# Altium schematic sheet POWER.SchDoc
size A2; SheetNumber: 3; SheetTotal: 3
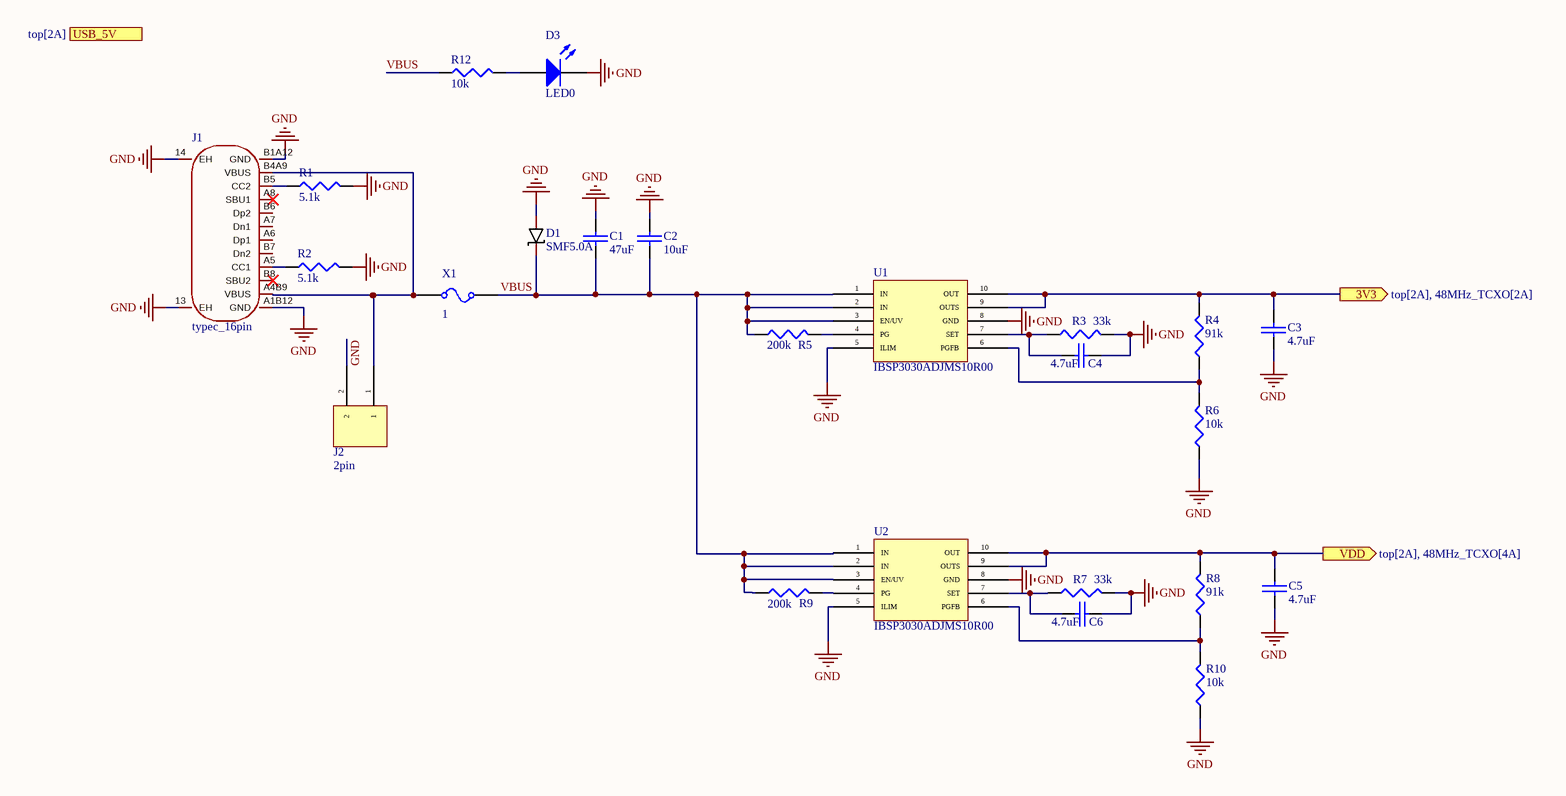
[diagram p0: POWER.SchDoc]

## Parts
C1  47uF  [0402_Z]
C2  10uF  [0603_Z]
C3  4.7uF  [0603_Z]
C4  4.7uF  [0603_Z]
C5  4.7uF  [0603_Z]
C6  4.7uF  [0603_Z]
D1  SMF5.0A  [SMF5.0A]
D3  LED0  [0603_Z]
J1  typec_16pin  [TYPEC_16PIN]
J2  2pin  [H2-2mm]
R1  5.1k  [0402_Z]
R2  5.1k  [0402_Z]
R3  33k  [0402_Z]
R4  91k  [0402_Z]
R5  200k  [0402_Z]
R6  10k  [0402_Z]
R7  33k  [0402_Z]
R8  91k  [0402_Z]
R9  200k  [0402_Z]
R10  10k  [0402_Z]
R12  10k  [0402_Z]
U1  IBSP3030ADJMS10R00  [IBSP3030ADJMS10R00]
U2  IBSP3030ADJMS10R00  [IBSP3030ADJMS10R00]
X1  CURRENT: 1  [F1206]  (hidden comment: Fuse)

## Ports
3V3 (out, see top[2A], 48MHz_TCXO[2A]), USB_5V (in, see top[2A]), VDD (out, see top[2A], 48MHz_TCXO[4A])

## Nets
GND: C1.1 C2.1 C3.2 C4.1 C5.2 C6.1 D1.2 D3.2(K) J1.13(EH) J1.14(EH) J1.A1B12(GND) J1.B1A12(GND) J2.2 R1.2 R2.2 R3.2 R6.1 R7.2 R10.1 U1.5(ILIM) U1.8(GND) U2.5(ILIM) U2.8(GND)
3V3: C3.1 R4.2 U1.9(OUTS) U1.10(OUT) ; port 3V3
VBUS: C1.2 C2.2 D1.1 R5.1 R9.1 R12.1 U1.1(IN) U1.2(IN) U1.3(EN/UV) U2.1(IN) U2.2(IN) U2.3(EN/UV) X1.1
VDD: C5.1 R8.2 U2.9(OUTS) U2.10(OUT) ; port VDD
NetC4_2: C4.2 R3.1 U1.7(SET)
NetC6_2: C6.2 R7.1 U2.7(SET)
NetD3_1: D3.1(A) R12.2
NetJ1_A4B9: J1.A4B9(VBUS) J1.B4A9(VBUS) J2.1 X1.2
NetJ1_A5: J1.A5(CC1) R2.1
NetJ1_B5: J1.B5(CC2) R1.1
NetR4_1: R4.1 R6.2 U1.6(PGFB)
NetR5_2: R5.2 U1.4(PG)
NetR8_1: R8.1 R10.2 U2.6(PGFB)
NetR9_2: R9.2 U2.4(PG)

Not connected (* = marked no-connect by the designer): J1 A6(Dp1) A7(Dn1) A8(SBU1)* B6(Dp2) B7(Dn2) B8(SBU2)*

## Library data of the parts
C1 = CAP: 0805; Value: 20pF  NP0
C2 = CAP: 0603; Value: 20pF  NP0
C3-C6 = CAP: 0402; Value: 20pF  NP0
D3 = LED0: Typical INFRARED GaAs LED; Published: 8-Jun-2000; LatestRevisionDate: 08-Jul-2005; LatestRevisionNote: Mech Layer 1 removed.; PackageReference: LED-0; Publisher: Altium Limited; PackageDescription: LED; 2 Leads
R1-R10 R12 = Res3: Resistor; Published: 8-Jun-2000; LatestRevisionDate: 04-Mar-2005; LatestRevisionNote: PCB Footprint replaced.; PackageReference: J1-0603; Publisher: Altium Limited
  R1 R2: Value: 5.1k
  R3 R7: Value: 33k
  R4 R8: Value: 91k
  R5 R9: Value: 200k
  R6 R10 R12: Value: 10k
X1 = Fuse: RESISTANCE: 1m; SimulationGenericComponent: True